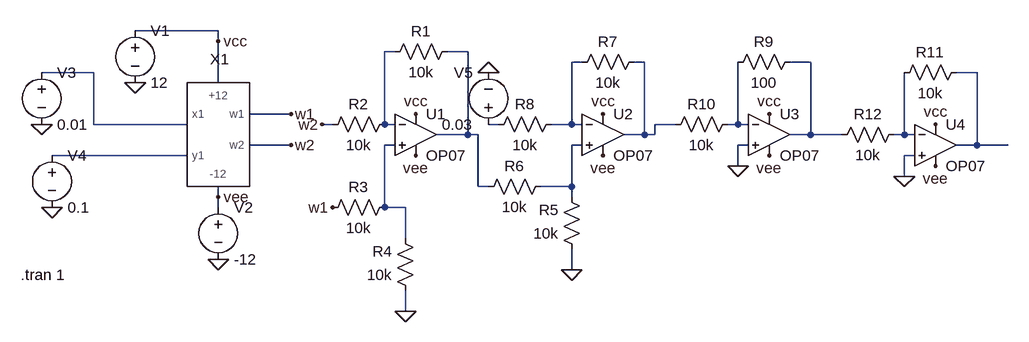
[diagram p0: schematic test_mul.asc]
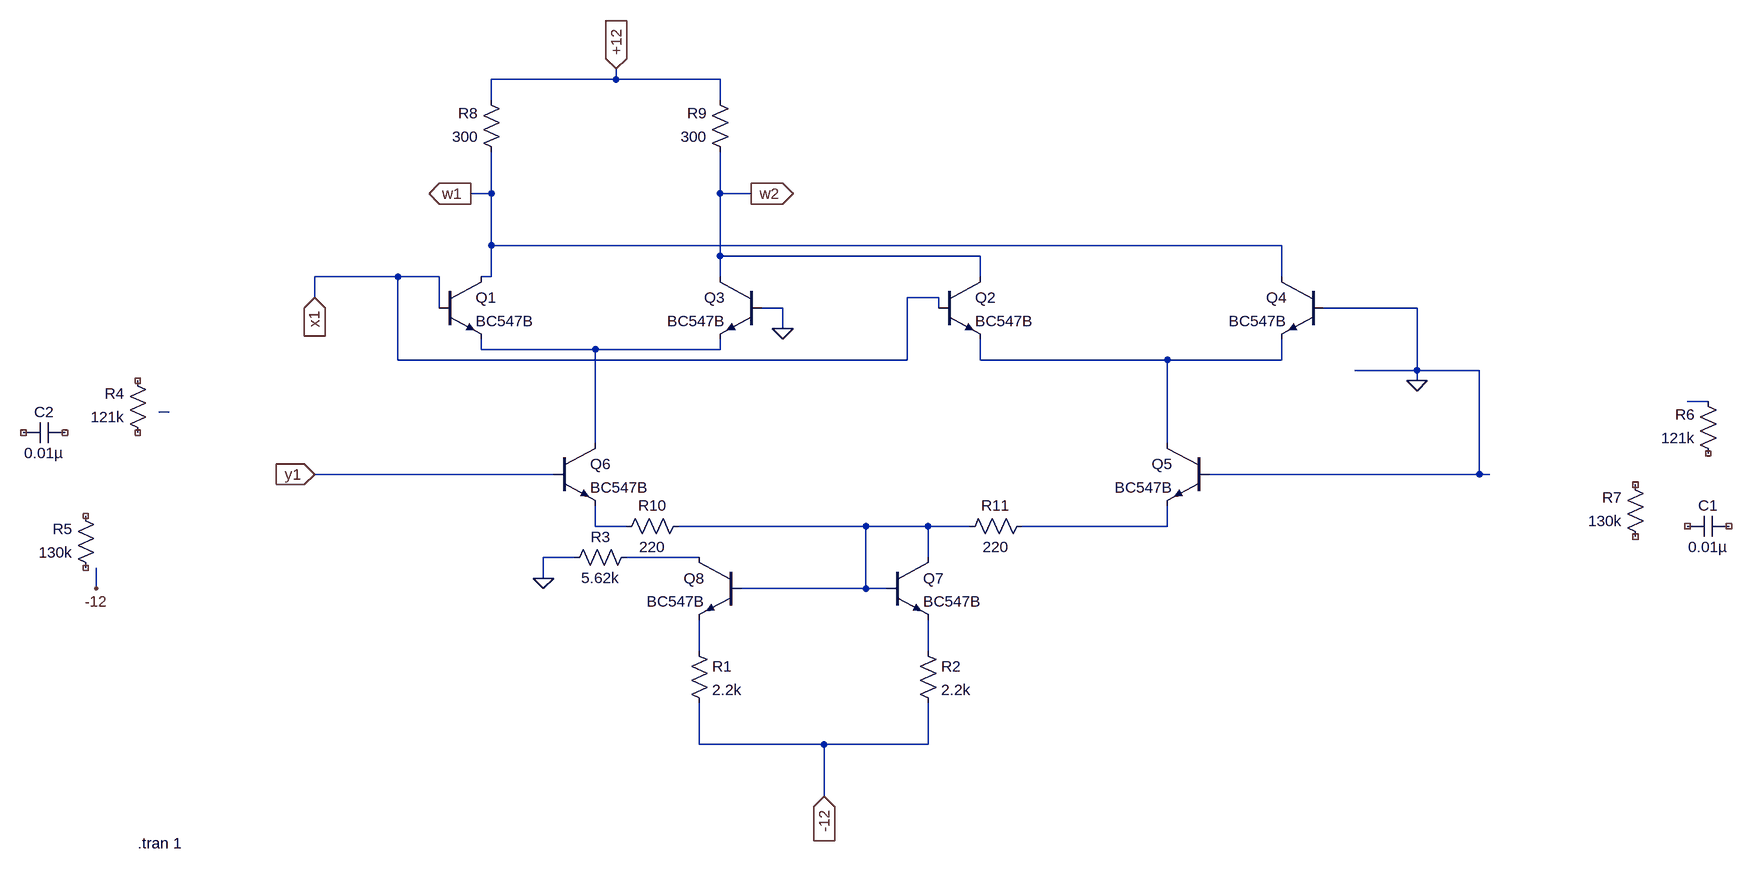
[diagram p1: sub-circuit multipeir_3.asc]
test_mul.asc, the LTspice schematic file:
Version 4.1
SHEET 1 1380 680
WIRE 160 0 32 0
WIRE 160 16 160 0
WIRE 432 32 416 32
WIRE 544 32 512 32
WIRE 720 48 704 48
WIRE 816 48 800 48
WIRE 1072 48 1040 48
WIRE -32 64 -112 64
WIRE 1328 64 1296 64
WIRE 160 80 160 16
WIRE 272 128 208 128
WIRE -32 144 -32 64
WIRE 112 144 112 128
WIRE 112 144 -32 144
WIRE 336 144 320 144
WIRE 416 144 416 32
WIRE 432 144 416 144
WIRE 592 144 576 144
WIRE 704 144 704 48
WIRE 704 144 672 144
WIRE 720 144 704 144
WIRE 864 144 832 144
WIRE 960 144 960 48
WIRE 960 144 944 144
WIRE 976 144 960 144
WIRE 544 160 544 32
WIRE 544 160 496 160
WIRE 560 160 544 160
WIRE 816 160 816 48
WIRE 816 160 784 160
WIRE 832 160 832 144
WIRE 832 160 816 160
WIRE 1072 160 1072 48
WIRE 1072 160 1040 160
WIRE 1120 160 1072 160
WIRE 1216 160 1216 64
WIRE 1216 160 1200 160
WIRE 1232 160 1216 160
WIRE 272 176 208 176
WIRE 432 176 416 176
WIRE 720 176 704 176
WIRE 976 176 960 176
WIRE 1328 176 1328 64
WIRE 1328 176 1296 176
WIRE 1376 176 1328 176
WIRE 112 192 -96 192
WIRE 1232 192 1216 192
WIRE 960 208 960 176
WIRE 1216 224 1216 192
WIRE 560 240 560 160
WIRE 576 240 560 240
WIRE 704 240 704 176
WIRE 704 240 656 240
WIRE 160 256 160 240
WIRE 704 256 704 240
WIRE 160 272 160 256
WIRE 416 272 416 176
WIRE 448 272 416 272
WIRE 448 320 448 272
WIRE 704 368 704 336
WIRE 448 432 448 400
FLAG 32 80 0
FLAG 160 352 0
FLAG -96 272 0
FLAG -112 144 0
FLAG 272 128 w1
FLAG 272 176 w2
FLAG 448 432 0
FLAG 320 144 w2
FLAG 336 272 w1
FLAG 960 208 0
FLAG 704 368 0
FLAG 160 16 vcc
FLAG 464 128 vcc
FLAG 752 128 vcc
FLAG 1008 128 vcc
FLAG 1008 192 vee
FLAG 752 192 vee
FLAG 464 192 vee
FLAG 160 256 vee
FLAG 576 64 0
FLAG 1216 224 0
FLAG 1264 144 vcc
FLAG 1264 208 vee
SYMBOL multipeir_3 160 160 R0
SYMATTR InstName X1
SYMBOL voltage 32 -16 R0
WINDOW 123 0 0 Left 0
WINDOW 39 0 0 Left 0
SYMATTR InstName V1
SYMATTR Value 12
SYMBOL voltage 160 256 R0
WINDOW 123 0 0 Left 0
WINDOW 39 0 0 Left 0
SYMATTR InstName V2
SYMATTR Value -12
SYMBOL voltage -112 48 R0
WINDOW 123 0 0 Left 0
WINDOW 39 0 0 Left 0
SYMATTR InstName V3
SYMATTR Value 0.01
SYMBOL voltage -96 176 R0
WINDOW 123 0 0 Left 0
WINDOW 39 0 0 Left 0
SYMATTR InstName V4
SYMATTR Value 0.1
SYMBOL OpAmps\\OP07 464 96 R0
SYMATTR InstName U1
SYMBOL OpAmps\\OP07 752 96 R0
SYMATTR InstName U2
SYMBOL OpAmps\\OP07 1008 96 R0
SYMATTR InstName U3
SYMBOL res 528 16 R90
WINDOW 0 0 56 VBottom 2
WINDOW 3 32 56 VTop 2
SYMATTR InstName R1
SYMATTR Value 10k
SYMBOL res 432 128 R90
WINDOW 0 0 56 VBottom 2
WINDOW 3 32 56 VTop 2
SYMATTR InstName R2
SYMATTR Value 10k
SYMBOL res 432 256 R90
WINDOW 0 0 56 VBottom 2
WINDOW 3 32 56 VTop 2
SYMATTR InstName R3
SYMATTR Value 10k
SYMBOL res 464 416 R180
WINDOW 0 36 76 Left 2
WINDOW 3 36 40 Left 2
SYMATTR InstName R4
SYMATTR Value 10k
SYMBOL res 720 352 R180
WINDOW 0 36 76 Left 2
WINDOW 3 36 40 Left 2
SYMATTR InstName R5
SYMATTR Value 10k
SYMBOL res 560 256 R270
WINDOW 0 32 56 VTop 2
WINDOW 3 0 56 VBottom 2
SYMATTR InstName R6
SYMATTR Value 10k
SYMBOL res 704 64 R270
WINDOW 0 32 56 VTop 2
WINDOW 3 0 56 VBottom 2
SYMATTR InstName R7
SYMATTR Value 10k
SYMBOL res 576 160 R270
WINDOW 0 32 56 VTop 2
WINDOW 3 0 56 VBottom 2
SYMATTR InstName R8
SYMATTR Value 10k
SYMBOL res 1056 32 R90
WINDOW 0 0 56 VBottom 2
WINDOW 3 32 56 VTop 2
SYMATTR InstName R9
SYMATTR Value 100
SYMBOL res 960 128 R90
WINDOW 0 0 56 VBottom 2
WINDOW 3 32 56 VTop 2
SYMATTR InstName R10
SYMATTR Value 10k
SYMBOL voltage 576 160 R180
WINDOW 0 24 96 Left 2
WINDOW 3 24 16 Left 2
WINDOW 123 0 0 Left 0
WINDOW 39 0 0 Left 0
SYMATTR InstName V5
SYMATTR Value 0.03
SYMBOL OpAmps\\OP07 1264 112 R0
SYMATTR InstName U4
SYMBOL res 1312 48 R90
WINDOW 0 0 56 VBottom 2
WINDOW 3 32 56 VTop 2
SYMATTR InstName R11
SYMATTR Value 10k
SYMBOL res 1216 144 R90
WINDOW 0 0 56 VBottom 2
WINDOW 3 32 56 VTop 2
SYMATTR InstName R12
SYMATTR Value 10k
TEXT -144 376 Left 2 !.tran 1

multipeir_3.asc, the sub-circuit schematic file:
Version 4.1
SHEET 1 2080 996
WIRE 240 -208 240 -224
WIRE 240 -208 48 -208
WIRE 400 -208 240 -208
WIRE 48 -176 48 -208
WIRE 400 -176 400 -208
WIRE 48 -32 48 -96
WIRE 48 -32 16 -32
WIRE 400 -32 400 -96
WIRE 448 -32 400 -32
WIRE 48 48 48 -32
WIRE 1264 48 48 48
WIRE 400 64 400 -32
WIRE 800 64 400 64
WIRE -96 96 -224 96
WIRE -32 96 -96 96
WIRE 48 96 48 48
WIRE 48 96 32 96
WIRE 400 96 400 64
WIRE 800 96 800 64
WIRE 1264 96 1264 48
WIRE -224 128 -224 96
WIRE 736 128 688 128
WIRE -32 144 -32 96
WIRE 496 144 464 144
WIRE 736 144 736 128
WIRE 1472 144 1328 144
WIRE 496 176 496 144
WIRE 32 208 32 192
WIRE 208 208 32 208
WIRE 400 208 400 192
WIRE 400 208 208 208
WIRE -96 224 -96 96
WIRE 688 224 688 128
WIRE 688 224 -96 224
WIRE 800 224 800 192
WIRE 1088 224 800 224
WIRE 1264 224 1264 192
WIRE 1264 224 1088 224
WIRE 1472 240 1472 144
WIRE 1472 240 1376 240
WIRE 1568 240 1472 240
WIRE 1472 256 1472 240
WIRE 1920 288 1888 288
WIRE -448 304 -464 304
WIRE 208 352 208 208
WIRE 1088 352 1088 224
WIRE 144 400 -224 400
WIRE 1568 400 1568 240
WIRE 1568 400 1152 400
WIRE 1584 400 1568 400
WIRE 208 480 208 448
WIRE 256 480 208 480
WIRE 624 480 336 480
WIRE 720 480 624 480
WIRE 784 480 720 480
WIRE 1088 480 1088 448
WIRE 1088 480 864 480
WIRE 176 528 128 528
WIRE 368 528 256 528
WIRE 720 528 720 480
WIRE 128 560 128 528
WIRE -560 576 -560 544
WIRE 624 576 624 480
WIRE 624 576 432 576
WIRE 656 576 624 576
WIRE 368 672 368 624
WIRE 720 672 720 624
WIRE 368 816 368 752
WIRE 560 816 368 816
WIRE 720 816 720 752
WIRE 720 816 560 816
WIRE 560 896 560 816
FLAG 1472 256 0
FLAG 128 560 0
FLAG -560 576 -12
FLAG 496 176 0
FLAG 240 -224 +12
IOPIN 240 -224 In
FLAG 560 896 -12
IOPIN 560 896 In
FLAG -224 128 x1
IOPIN -224 128 In
FLAG -224 400 y1
IOPIN -224 400 In
FLAG 16 -32 w1
IOPIN 16 -32 Out
FLAG 448 -32 w2
IOPIN 448 -32 Out
SYMBOL npn -32 96 R0
SYMATTR InstName Q1
SYMATTR Value BC547B
SYMBOL npn 736 96 R0
SYMATTR InstName Q2
SYMATTR Value BC547B
SYMBOL npn 464 96 M0
SYMATTR InstName Q3
SYMATTR Value BC547B
SYMBOL npn 1328 96 M0
SYMATTR InstName Q4
SYMATTR Value BC547B
SYMBOL npn 1152 352 M0
SYMATTR InstName Q5
SYMATTR Value BC547B
SYMBOL npn 144 352 R0
SYMATTR InstName Q6
SYMATTR Value BC547B
SYMBOL npn 656 528 R0
SYMATTR InstName Q7
SYMATTR Value BC547B
SYMBOL npn 432 528 M0
SYMATTR InstName Q8
SYMATTR Value BC547B
SYMBOL res 352 656 R0
SYMATTR InstName R1
SYMATTR Value 2.2k
SYMBOL res 704 656 R0
SYMATTR InstName R2
SYMATTR Value 2.2k
SYMBOL res 272 512 R90
WINDOW 0 0 56 VBottom 2
WINDOW 3 32 56 VTop 2
SYMATTR InstName R3
SYMATTR Value 5.62k
SYMBOL res -480 352 R180
WINDOW 0 36 76 Left 2
WINDOW 3 36 40 Left 2
SYMATTR InstName R4
SYMATTR Value 121k
SYMATTR SpiceLine tol=0 pwr=0
SYMBOL res -560 560 R180
WINDOW 0 36 76 Left 2
WINDOW 3 36 40 Left 2
SYMATTR InstName R5
SYMATTR Value 130k
SYMBOL res 1936 384 R180
WINDOW 0 36 76 Left 2
WINDOW 3 36 40 Left 2
SYMATTR InstName R6
SYMATTR Value 121k
SYMBOL res 1824 512 R180
WINDOW 0 36 76 Left 2
WINDOW 3 36 40 Left 2
SYMATTR InstName R7
SYMATTR Value 130k
SYMBOL res 64 -80 R180
WINDOW 0 36 76 Left 2
WINDOW 3 36 40 Left 2
SYMATTR InstName R8
SYMATTR Value 300
SYMBOL res 416 -80 R180
WINDOW 0 36 76 Left 2
WINDOW 3 36 40 Left 2
SYMATTR InstName R9
SYMATTR Value 300
SYMBOL cap 1952 464 R90
WINDOW 0 0 32 VBottom 2
WINDOW 3 32 32 VTop 2
SYMATTR InstName C1
SYMATTR Value 0.01µ
SYMBOL cap -608 320 R90
WINDOW 0 0 32 VBottom 2
WINDOW 3 32 32 VTop 2
SYMATTR InstName C2
SYMATTR Value 0.01µ
SYMBOL res 352 464 R90
WINDOW 0 0 56 VBottom 2
WINDOW 3 32 56 VTop 2
SYMATTR InstName R10
SYMATTR Value 220
SYMBOL res 880 464 R90
WINDOW 0 0 56 VBottom 2
WINDOW 3 32 56 VTop 2
SYMATTR InstName R11
SYMATTR Value 220
TEXT -496 968 Left 2 !.tran 1

The netlist it stands for:
* test_mul.asc
X§X1 vcc vee N006 N013 w2 w1 multipeir_3
V1 vcc 0 12
V2 vee 0 -12
V3 N006 0 0.01
V4 N013 0 0.1
X§U1 N011 N001 vcc vee N002 LT1001  ; OP07, pins In+ In- V+ V- OUT
X§U2 N012 N003 vcc vee N004 LT1001  ; OP07, pins In+ In- V+ V- OUT
X§U3 0 N009 vcc vee N005 LT1001  ; OP07, pins In+ In- V+ V- OUT
R1 N002 N001 10k
R2 N001 w2 10k
R3 N011 w1 10k
R4 0 N011 10k
R5 0 N012 10k
R6 N002 N012 10k
R7 N003 N004 10k
R8 N008 N003 10k
R9 N005 N009 100
R10 N009 N004 10k
V5 N008 0 0.03
X§U4 0 N010 vcc vee N007 LT1001  ; OP07, pins In+ In- V+ V- OUT
R11 N007 N010 10k
R12 N010 N005 10k

* block symbol definitions
.subckt multipeir_3 +12 -12 x1 y1 w2 w1
Q1 w1 x1 N001 0 BC547B
Q2 w2 x1 N002 0 BC547B
Q3 w2 0 N001 0 BC547B
Q4 w1 0 N002 0 BC547B
Q5 N002 0 N007 0 BC547B
Q6 N001 y1 N005 0 BC547B
Q7 N006 N006 N010 0 BC547B
Q8 N008 N006 N009 0 BC547B
R1 N009 -12 2.2k
R2 N010 -12 2.2k
R3 N008 0 5.62k
R4 NC_01 NC_02 121k tol=0 pwr=0
R5 NC_03 NC_04 130k
R6 NC_05 N003 121k
R7 NC_06 NC_07 130k
R8 w1 +12 300
R9 w2 +12 300
C1 NC_08 NC_09 0.01µ
C2 NC_10 NC_11 0.01µ
R10 N006 N005 220
R11 N007 N006 220
.tran 1
.ends multipeir_3

.model NPN NPN
.model PNP PNP
.lib standard.bjt
.tran 1
.lib LTC.lib
.backanno
.end